# Altium schematic sheet ts2068Interface.SchDoc
size A; SheetNumber: 2; SheetTotal: 5
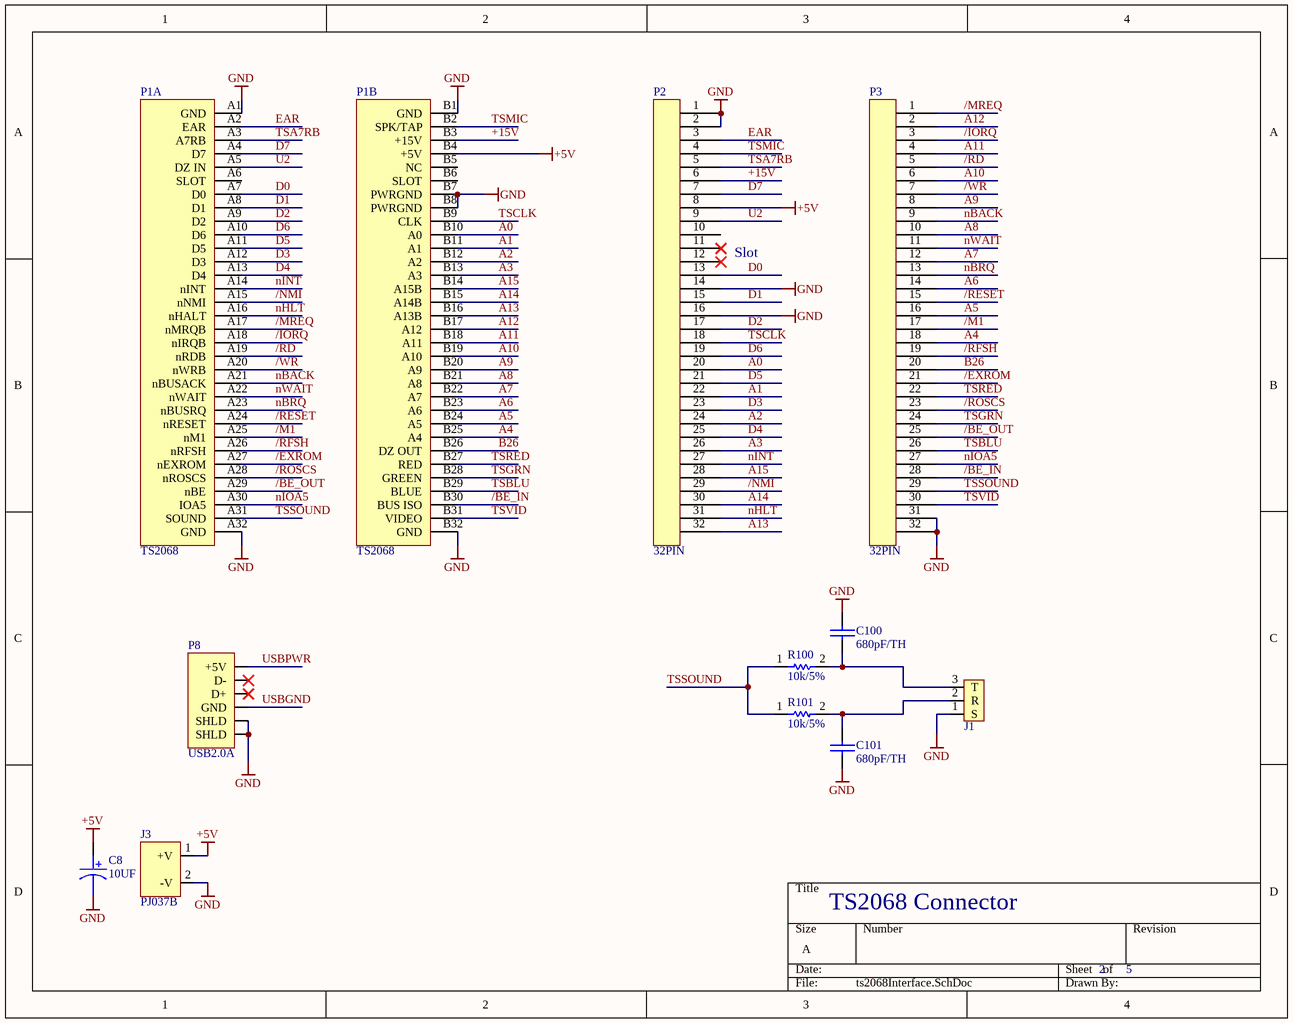
[diagram p0: ts2068Interface.SchDoc]

## Parts
C8  10UF  [CAP10EL]
C100  680pF/TH  [WIMIA_BOX2.7X4.5]
C101  680pF/TH  [WIMIA_BOX2.7X4.5]
J1  STX-3000  [STX-3000]  (value not drawn)
J3  PJ037B  [PJ037B]
P1  TS2068  [TS2068A]  (parts A,B of 2)
P2  32PIN  [IDC32]
P3  32PIN  [IDC32]
P8  USB2.0A  [USBA_AU-Y1005]
R100  10k/5%  [CF18]
R101  10k/5%  [CF18]

## Nets
+5V: C8.1 J3.1(+V) P1.B4(+5V) P2.8
GND: C8.2 C100.1 C101.2 J1.1(S) J3.2(-V) P1.A1(GND) P1.A32(GND) P1.B1(GND) P1.B7(PWRGND) P1.B8(PWRGND) P1.B32(GND) P2.1 P2.2 P2.14 P2.16 P3.31 P3.32 P8.5(SHLD) P8.6(SHLD)
+15V: P1.B3(+15V) P2.6
/BE_IN: P1.B30(BUS_ISO) P3.28
/BE_OUT: P1.A29(nBE) P3.25
/EXROM: P1.A27(nEXROM) P3.21
/IORQ: P1.A18(nIRQB) P3.3
/M1: P1.A25(nM1) P3.17
/MREQ: P1.A17(nMRQB) P3.1
/NMI: P1.A15(nNMI) P2.29
/RD: P1.A19(nRDB) P3.5
/RESET: P1.A24(nRESET) P3.15
/RFSH: P1.A26(nRFSH) P3.19
/ROSCS: P1.A28(nROSCS) P3.23
/WR: P1.A20(nWRB) P3.7
A0: P1.B10(A0) P2.20
A1: P1.B11(A1) P2.22
A2: P1.B12(A2) P2.24
A3: P1.B13(A3) P2.26
A4: P1.B25(A4) P3.18
A5: P1.B24(A5) P3.16
A6: P1.B23(A6) P3.14
A7: P1.B22(A7) P3.12
A8: P1.B21(A8) P3.10
A9: P1.B20(A9) P3.8
A10: P1.B19(A10) P3.6
A11: P1.B18(A11) P3.4
A12: P1.B17(A12) P3.2
A13: P1.B16(A13B) P2.32
A14: P1.B15(A14B) P2.30
A15: P1.B14(A15B) P2.28
B26: P1.B26(DZ_OUT) P3.20
D0: P1.A7(D0) P2.13
D1: P1.A8(D1) P2.15
D2: P1.A9(D2) P2.17
D3: P1.A12(D3) P2.23
D4: P1.A13(D4) P2.25
D5: P1.A11(D5) P2.21
D6: P1.A10(D6) P2.19
D7: P1.A4(D7) P2.7
EAR: P1.A2(EAR) P2.3
nBACK: P1.A21(nBUSACK) P3.9
nBRQ: P1.A23(nBUSRQ) P3.13
nHLT: P1.A16(nHALT) P2.31
nINT: P1.A14(nINT) P2.27
nIOA5: P1.A30(IOA5) P3.27
nWAIT: P1.A22(nWAIT) P3.11
TSA7RB: P1.A3(A7RB) P2.5
TSBLU: P1.B29(BLUE) P3.26
TSCLK: P1.B9(CLK) P2.18
TSGRN: P1.B28(GREEN) P3.24
TSMIC: P1.B2(SPK/TAP) P2.4
TSRED: P1.B27(RED) P3.22
TSSOUND: P1.A31(SOUND) P3.29 R100.1 R101.1
TSVID: P1.B31(VIDEO) P3.30
U2: P1.A5(DZ_IN) P2.9
USBGND: P8.4(GND)
USBPWR: P8.1(+5V)
NetC100_2: C100.2 J1.3(T) R100.2
NetC101_1: C101.1 J1.2(R) R101.2

Not connected (* = marked no-connect by the designer): P1 A6(SLOT) B5(NC) B6(SLOT); P2 10 11* 12*; P8 2(D-)* 3(D+)*

## Notes on the sheet
- Slot
- TS2068 Connector

## Library data of the parts
C8 = 10UF: CAP ALUM 10UF 20% 16V RADIAL; MFG: Panasonic; MFG PN: ECE-A1CKA100; DK PN: P807-ND
C100 C101 = 680pF/TH: CAP FILM 680PF 10% 100VDC RAD; MFG: WIMA; MFG PN: FKP2D006801D00KSSD; DK PN: 1928-1238-ND; Price: 1.17
J1 = STX-3000: 3.50mm (0.141", 1/8", Mini Plug) - Headphone Phone Jack Stereo (3 Conductor, TRS) Connector Kinked Pin; DK PN: 2092-STX-3000-ND; MFG: Kycon, Inc.; MFG PN: STX-3000
J3 = PJ037B: Power Barrel Connector Jack 2.50mm ID (0.098"), 5.50mm OD (0.217") Through Hole, Right Angle; MFG PN: PJ-037B; DK PN: CP-037B-ND; MFG: CUI
P8 = USB2.0A: USB-A (USB TYPE-A) USB 2.0 Receptacle Connector 4 Position Through Hole, Right Angle; MFG: Adam Tech; MFG PN: USB-A-S-RA; DK PN: 2057-USB-A-S-RA-ND
R100 R101 = 10k/5%: RES 10K OHM 5% 1/8W AXIAL; MFG PN: CF18JT10K0; DK PN: CF18JT10K0CT-ND; MFG: Stackpole; Populate: *
P1 = TS2068: Populate: *
P2 P3 = 32PIN: MFG: *; MFG PN: *; DK PN: *; Price: *